# Altium schematic sheet Sheet1.SchDoc
size A4; SheetNumber: 1; SheetTotal: 2; SPICEModelCacheUKBIIACK: <root> / <DocumentId>UKBIIACK</DocumentId> / <CacheFrame Number="0"> / <Model Name="tl082" Kind="CKT"> / <Text>*TL082 / *Dual WideBW JFETInput OpAmp pkg:DIP8 (A:3,2,8,4,1)(B:5,6,8,4,7) / * Connections: / *             Non-Inverting Input / *             | Inverting Input / *             | | Positive Power Supply / *             | | | Negative Power Supply / *             | | | | Output / *             | | | | | / .SUBCKT TL082 1 2 3 4 5 / C1   11 12 3.498E-12 / C2    6  7 15E-12 / DC    5 53 DX / DE   54  5 DX / DLP  90 91 DX / DLN  92 90 DX / DP    4  3 DX / BGND 99  0 V=V(3)*.5 + V(4)*.5 / BB    7 99 I=I(VB)*4.715E6 - I(VC)*5E6 + I(VE)*5E6 + / +              I(VLP)*5E6 - I(VLN)*5E6 / GA    6  0 11 12 282.8E-6 / GCM   0  6 10 99 8.942E-9 / ISS   3 10 DC 195E-6 / HLIM 90  0 VLIM 1K / J1   11  2 10 JX / J2   12  1 10 JX / R2    6  9 100E3 / RD1   4 11 3.536E3 / RD2   4 12 3.536E3 / RO1   8  5 150 / RO2   7 99 150 / RP    3  4 2.143E3 / RSS  10 99 1.026E6 / VB    9  0 DC 0 / VC    3 53 DC 2.2 / VE   54  4 DC 2.2 / VLIM  7  8 DC 0 / VLP  91  0 DC 25 / VLN   0 92 DC 25 / .MODEL DX D(IS=800E-18) / .MODEL JX PJF(IS=15E-12 BETA=270.1E-6 VTO=-1) / .ENDS TL082</Text> / </Model> / <Model Name="1n4005" Kind="MDL"> / <Text>*1N4005 MCE 8-16-95 / *600V 1A Si GenPurpose Diode pkg:DIODE0.4 1,2 / .MODEL 1N4005 D(IS=2.55E-9 RS=0.042 N=1.75 TT=5.76E-6 CJO=1.85E-11 / + VJ=0.75 M=0.333 BV=600 IBV=5.92E-5 )</Text> / </Model> / <Model Name="ni3wtrans" Kind="CKT"> / <Text>*Non-ideal 4-winding Transformer / *jjt created 18/1/2001. / *jjt 18/1/2002: changed LX2D,LX3D comments to match subcircuit parameters (X2D, X3D) to avoid possible confusion. / *Connections: / *                 Pri+ / *                 |   Pri- / *                 |   |   Sec1+ / *                 |   |   |   Sec1- / *                 |   |   |   |   Sec2+ / *                 |   |   |   |   |   Sec2- / *                 |   |   |   |   |   | / *                 |   |   |   |   |   | / *                 |   |   |   |   |   | / *                 |   |   |   |   |   | / .SUBCKT NI3WTRANS 1   2   3   4   5   6      PARAMS: RATIO1=1 RATIO2=1 RPRI=0.1 R2D=0.1 R3D=0.1 L1=1U / + X2D=1u X3D=1u XM=1k RCORE=1Meg / VISRC1   4 11 0V / VISRC2   6 14 0V / FCTRL1   10 2 VISRC1 {RATIO1} / FCTRL2   13 2 VISRC2 {RATIO2} / EVCVS1   3 11 10 2 {RATIO1} / EVCVS2   5 14 13 2 {RATIO2} / RRPRI    1 8 {RPRI} / RR2D    9 10 {R2D} / RR3D    12 13 {R3D} / LL1   8 7 {L1} / LX2D  7 9 {X2D} / LX3D  7 12 {X3D} / LXM   7 2 {XM} / RRCORE 7 2 {RCORE} / .ENDS NI3WTRANS</Text> / </Model> / </CacheFrame> / </root>
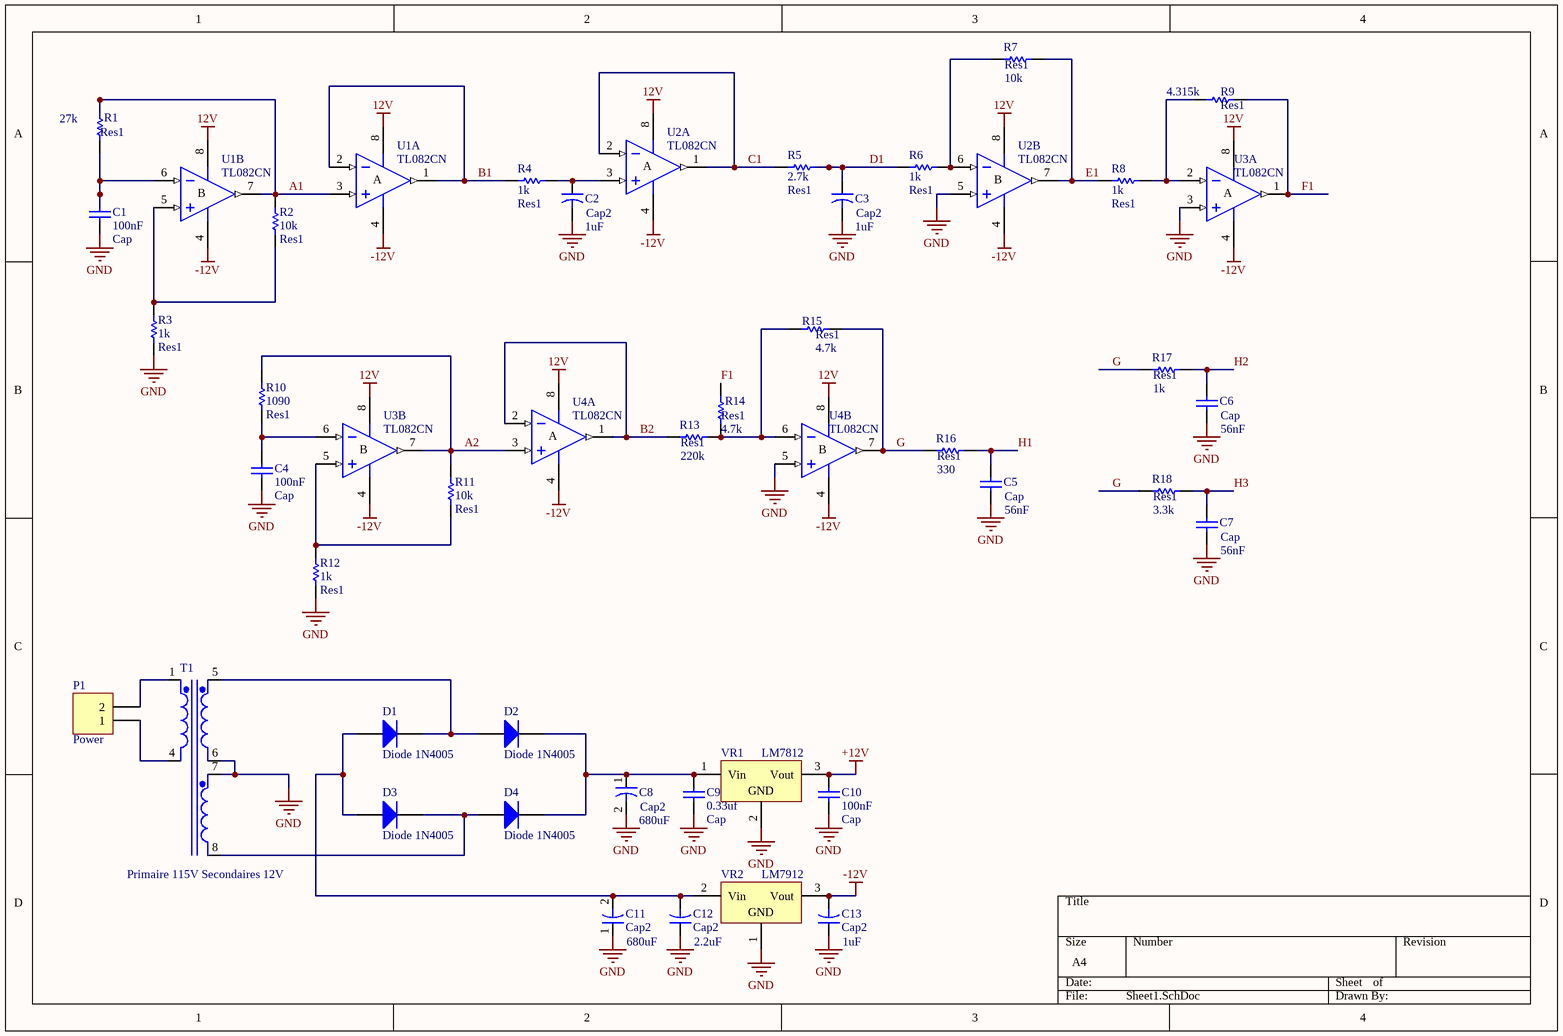
[diagram p0: Sheet1.SchDoc]

## Parts
C1  Cap  value 100nF  [RAD-0.3]
C2  Cap2  value 1uF  [CAPR5-4X5]
C3  Cap2  value 1uF  [CAPR5-4X5]
C4  Cap  value 100nF  [RAD-0.3]
C5  Cap  value 56nF  [RAD-0.3]
C6  Cap  value 56nF  [RAD-0.3]
C7  Cap  value 56nF  [RAD-0.3]
C8  Cap2  value 680uF  [CAPR5-4X5]
C9  Cap  value 0.33uf  [RAD-0.3]
C10  Cap  value 100nF  [RAD-0.3]
C11  Cap2  value 680uF  [CAPR5-4X5]
C12  Cap2  value 2.2uF  [CAPR5-4X5]
C13  Cap2  value 1uF  [CAPR5-4X5]
D1  Diode 1N4005  [DO-41]
D2  Diode 1N4005  [DO-41]
D3  Diode 1N4005  [DO-41]
D4  Diode 1N4005  [DO-41]
P1  Power  [HDR1X2]
R1  Res1  value 27k  [AXIAL-0.3]
R2  Res1  value 10k  [AXIAL-0.3]
R3  Res1  value 1k  [AXIAL-0.3]
R4  Res1  value 1k  [AXIAL-0.3]
R5  Res1  value 2.7k  [AXIAL-0.3]
R6  Res1  value 1k  [AXIAL-0.3]
R7  Res1  value 10k  [AXIAL-0.3]
R8  Res1  value 1k  [AXIAL-0.3]
R9  Res1  value 4.315k  [AXIAL-0.3]
R10  Res1  value 1090  [AXIAL-0.3]
R11  Res1  value 10k  [AXIAL-0.3]
R12  Res1  value 1k  [AXIAL-0.3]
R13  Res1  value 220k  [AXIAL-0.3]
R14  Res1  value 4.7k  [AXIAL-0.3]
R15  Res1  value 4.7k  [AXIAL-0.3]
R16  Res1  value 330  [AXIAL-0.3]
R17  Res1  value 1k  [AXIAL-0.3]
R18  Res1  value 3.3k  [AXIAL-0.3]
T1  Primaire 115V Secondaires 12V  [TRF_6]
U1  TL082CN  [DIP8]  (parts A,B of 2)
U2  TL082CN  [DIP8]  (parts A,B of 2)
U3  TL082CN  [DIP8]  (parts A,B of 2)
U4  TL082CN  [DIP8]  (parts A,B of 2)
VR1  LM7812  [D2PAK_N]
VR2  LM7912  [D2PAK_N]

## Nets
12V: U1.8(V+) U2.8(V+) U3.8(V+) U4.8(V+)
+12V: C10.2 VR1.3(Vout)
-12V: C13.2 U1.4(V-) U2.4(V-) U3.4(V-) U4.4(V-) VR2.3(Vout)
GND: C1.1 C2.2 C3.2 C4.1 C5.1 C6.1 C7.1 C8.2 C9.1 C10.1 C11.1 C12.1 C13.1 R3.1 R12.1 T1.6(Sec1-) T1.7(Sec2+) U2.5(IN+) U3.3(IN+) U4.5(IN+) VR1.2(GND) VR2.1(GND)
A1: R1.2 R2.2 U1.3(IN+) U1.7(OUT)
A2: R10.2 R11.2 U3.7(OUT) U4.3(IN+)
B1: R4.2 U1.1(OUT) U1.2(IN-)
B2: R13.1 U4.1(OUT) U4.2(IN-)
C1: R5.2 U2.1(OUT) U2.2(IN-)
D1: C3.1 R5.1 R6.2
E1: R7.2 R8.1 U2.7(OUT)
F1: R9.2 R14.2 U3.1(OUT)
G: R15.2 R16.2 R17.2 R18.2 U4.7(OUT)
H1: C5.2 R16.1
H2: C6.2 R17.1
H3: C7.2 R18.1
NetC1_2: C1.2 R1.1 U1.6(IN-)
NetC2_1: C2.1 R4.1 U2.3(IN+)
NetC4_2: C4.2 R10.1 U3.6(IN-)
NetC8_1: C8.1 C9.2 D2.2(K) D4.2(K) VR1.1(Vin)
NetC11_2: C11.2 C12.2 D1.1(A) D3.1(A) VR2.2(Vin)
NetD1_2: D1.2(K) D2.1(A) T1.5(Sec1+)
NetD3_2: D3.2(K) D4.1(A) T1.8(Sec2-)
NetP1_1: P1.1 T1.4(Pri-)
NetP1_2: P1.2 T1.1(Pri+)
NetR2_1: R2.1 R3.2 U1.5(IN+)
NetR6_1: R6.1 R7.1 U2.6(IN-)
NetR8_2: R8.2 R9.1 U3.2(IN-)
NetR11_1: R11.1 R12.2 U3.5(IN+)
NetR13_2: R13.2 R14.1 R15.1 U4.6(IN-)

## Notes on the sheet
- (in symbol TL082CN, part A) A
- (in symbol TL082CN, part B) B

## Library data of the parts
C1 C4-C7 C9 C10 = Cap: Capacitor; Published: 8-Jun-2000; LatestRevisionDate: 17-Jul-2002; LatestRevisionNote: Re-released for DXP Platform.; PackageReference: RAD-0.3; Publisher: Altium Limited; PackageDescription: Radial Cap, Thru-Hole; 2 Leads; 0.3 in Pin Spacing
C2 C3 C8 C11-C13 = Cap2: Capacitor; Published: 23-Sep-2002; PackageReference: CAPR5-4X5; Publisher: Altium Limited; PackageDescription: Capacitor; 2 Leads
D1-D4 = Diode 1N4005: 1 Amp General Purpose Rectifier; Published: 8-Jun-2000; LatestRevisionDate: 17-Jul-2002; LatestRevisionNote: Re-released for DXP Platform.; DatasheetVersion: 1998; PackageVersion: Aug-1999; PackageReference: DO-41; Publisher: Altium Limited; PackageDescription: Diode, Axial; Body 5.2 x 2.7 mm (LxDia. max), Lead Dia. 0.86 mm (max); Code_JEDEC: DO-204-AL; ComponentLink1Description: Manufacturer Link; ComponentLink1URL: http://www.fairchildsemi.com/; ComponentLink2Description: Datasheet; ComponentLink2URL: http://www.fairchildsemi.com/ds/1N%2F1N4001.pdf
P1 = Header 2: Header, 2-Pin; LatestRevisionDate: 17-Jul-2002; LatestRevisionNote: Re-released for DXP Platform.; Publisher: Altium Limited
R1-R18 = Res1: Resistor; Published: 8-Jun-2000; LatestRevisionDate: 17-Jul-2002; LatestRevisionNote: Re-released for DXP Platform.; PackageReference: AXIAL-0.3; Publisher: Altium Limited; PackageDescription: Axial Device, Thru-Hole; 2 Leads; 0.3 in Pin Spacing
T1 = Trans3: Three-winding Transformer (Non-Ideal); Sim Note: Enter the turns ratios, Core loss resistance, Magnetising Reactance, Leakage Reactances and Resistances referred to the primary side into the parameter fields.; Published: 25-Jan-2001; LatestRevisionDate: 17-Jul-2002; LatestRevisionNote: Re-released for DXP Platform.; PackageReference: TRF_6; Publisher: Altium Limited; PackageDescription: Transformer; 6 Leads
U1-U4 = TL082CN: General-Purpose J-FET Dual Operational Amplifier; Published: 24-Aug-2001; LatestRevisionDate: 06-Jun-2005; LatestRevisionNote: Stylized 3D Model Added.; DatasheetVersion: Jan-1999; PackageReference: DIP8; Publisher: Altium Limited; PackageDescription: DIP; 8 Leads; Row Spacing 7.62 mm; Pitch 2.54 mm; Code_JEDEC: MO-001-AN; ComponentLink1Description: Manufacturer Link; ComponentLink1URL: http://www.st.com/; ComponentLink2Description: Datasheet; ComponentLink2URL: http://www.st.com/stonline/products/literature/ds/2300/tl082.pdf
VR1 VR2 = Volt Reg: Voltage Regulator; Published: 24-Mar-1999; LatestRevisionDate: 29-May-2009; LatestRevisionNote: IPC-7351 Footprint Added.; PackageReference: D2PAK; Publisher: Altium Limited; PackageDescription: 3-Pin Transistor Outline Package 2.54 mm Pitch, 15.1 mm Lead Span